# EasyEDA Pro project ProPrj_轮腿机器人-世博同学-正式版.epro, board PCB_ServoDebug
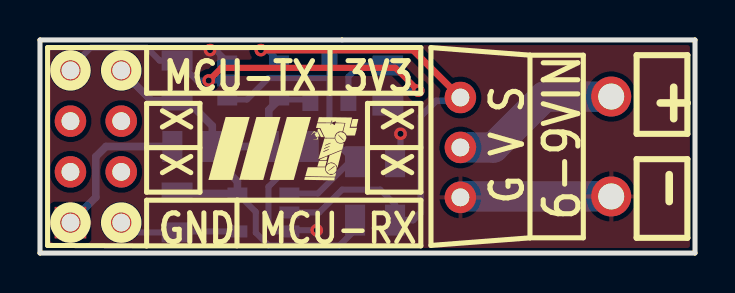
[diagram p7: board, top side]
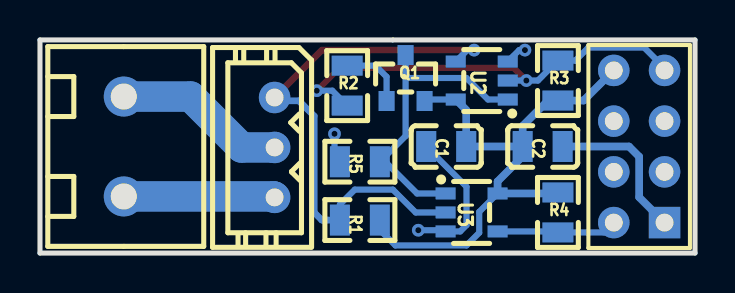
[diagram p8: board, bottom side, seen from below]

Outline 32.77 x 10.67 mm; copper layers: Top Layer, Bottom Layer. Coordinates in mm from the lower left corner of the outline.
Outline path: 0,10.67 32.77,10.67 32.77,0 0,0 0,10.67
Stack: Top Layer 0.035mm / Dielectric1 1.51mm FR4 er 4.5 / Bottom Layer 0.035mm

## Design rules (mm)
spacing Default (default): track to track 0.152, other pairs 0 to 0.152
track width Default (default): min 0.254, default 0.254, max 25.4
differential pair differentialPair (default): width min 0.127, default 0.254, max 2.54; gap min 0.152, default 0.152
via Default (default): diameter min 0.61, default 0.61, max 100.025; hole min 0.305, default 0.305, max 59.995
pour e81 uses gge4359

## Placement (name value [footprint] x y rotation side)
C1  0.1uF  [C0805]  12.45 5.33 0 bottom
C2  0.1uF  [C0805]  7.62 5.33 180 bottom
H1  HDR-F-2.54_2x4  [HDR-F-2.54_2X4]  2.79 5.33 90 bottom
H2  -  [5264-3A]  24.13 10.29 270 bottom
P3  WJ126V-5.0-2P  [CONN-TH_WJ126V-5.0-2P]  28.58 5.33 180 bottom
Q1  SS8550  [SOT-23_L2.9-W1.3-P0.95-LS2.4-BR]  14.48 8.76 270 bottom
R1  10k  [R0805]  16.76 1.65 180 bottom
R2  10k  [R0805]  17.4 8.38 90 bottom
R3  10k  [R0805]  6.86 8.64 270 bottom
R4  10k  [R0805]  6.86 2.03 90 bottom
R5  10k  [R0805]  16.76 4.57 180 bottom
U2  SN74LVC1G126DBVR  [SOT-23-5_L3.0-W1.7-P0.95-LS2.8-BR]  10.67 8.64 180 bottom
U3  SN74LVC1G125DBVR  [SOT-23-5_L3.0-W1.7-P0.95-LS2.8-BR]  11.18 2.03 0 bottom

## Footprints (pads in the part's own frame, mm; a bottom-side part is the same pattern mirrored in y, then rotated)
5264-3A
  round 1.575 hole 0.889: 1(2.5,3.1) 2(5,3.1) 3(7.5,3.1)
C0805
  rect 1x1.55 smd: 1(-1,0) 2(1,0)
CONN-TH_WJ126V-5.0-2P
  round 2 hole 1.3: 1(0,2.501) 2(0,-2.501)
HDR-F-2.54_2X4
  rect 1.575x1.575 hole 0.889: 1(-3.81,-1.27)
  round 1.575 hole 0.889: 2(-3.81,1.27) 3(-1.27,-1.27) 4(-1.27,1.27) 5(1.27,-1.27) 6(1.27,1.27) 7(3.81,-1.27) 8(3.81,1.27)
R0805
  rect 1x1.55 smd: 1(-1,0) 2(1,0)
SOT-23-5_L3.0-W1.7-P0.95-LS2.8-BR
  rect 1x0.6 smd: 1(1.3,-0.95) 2(1.3,0) 3(1.3,0.95) 4(-1.3,0.95) 5(-1.3,-0.95)
SOT-23_L2.9-W1.3-P0.95-LS2.4-BR
  rect 1x0.8 smd: 1(1.15,-0.95) 2(1.15,0.95) 3(-1.15,0)

## Nets
As in the schematic.

Pads without a net: H1 3 4 5 6

## Via types
v1: diameter 0.635, hole 0.305, Top Layer to Bottom Layer, 6 vias

## Routing (per net, layer and track width the routed paths; a pad name or vN(x,y) marks a point on that pad's centre or on a via; arc(x,y) is an arc through that point)
+3.3V: length 28
  Bottom Layer w0.305: U2.5 13.46,7.69 Q1.2 ; U3.5 10.8,2.06 10.8,1.02 11.43,0.38 14.99,0.38 15.76,1.16 R1.2
  Bottom Layer w0.381: R4.2 6.91,2.98 U3.5 9.88,3.59 8.62,4.84 C2.1 8.62,6.37 7.35,7.64 R3.2 5.57,7.64 H1.8 ; U2.5 11.45,7.16 C1.1 ; C1.1 11.59,5.33 ; C1.1 8.76,5.33
GND: length 25.4
  Bottom Layer w0.305: R5.1 18.03,4.84 v1(18.03,5.97) ; v1(8.51,10.16) 8.79,10.16 U2.3 ; v1(13.84,1.14) 12.54,1.14 U3.3 11.75,1.08 11.43,1.4 11.43,3.32 C1.2
  Bottom Layer w0.381: C2.2 3.3,5.33 2.79,4.83 2.79,2.79 H1.1
  Bottom Layer w1.524: P3.2 21.08,2.83 H2.3
VIN: length 8.6
  Bottom Layer w1.524: 21.03,5.29 22.68,5.29 25.23,7.83 P3.1
DATA: length 27.6
  Top Layer w0.33: v1(11.05,10.16) 18.66,10.16 H2.1
  Bottom Layer w0.305: R1.1 17.76,2.43 17.02,3.18 15.11,3.18 13.97,2.03 U3.2 ; v1(11.05,10.16) 11.39,10.16 U2.4
  Bottom Layer w0.33: H2.1 20.86,7.62 19.81,7.62 19.05,6.86 19.05,2.03 18.67,1.65 R1.1
R2_2: length 3.4
  Bottom Layer w0.305: Q1.1 15.43,8.82 15.99,9.38 R2.2
SERVO_RX: length 6
  Bottom Layer w0.305: H1.2 4.56,1.03 R4.1 6.91,1.08 U3.4
SERVO_TX: length 22.1
  Top Layer w0.305: v1(8.44,8.64) 9.07,9.27 17.78,9.27 v1(18.92,8.13)
  Bottom Layer w0.305: R2.1 18.15,8.13 v1(18.92,8.13) ; U2.2 v1(8.44,8.64) 7.86,8.64 R3.1 5.99,9.64 5.33,10.29 2.54,10.29 1.52,9.27 H1.7
TXEN: length 15.4
  Bottom Layer w0.305: U2.1 10.35,7.69 11.43,8.76 14.48,8.76 ; 14.48,8.76 Q1.3 ; 14.48,8.76 14.48,5.86 R5.2 15.49,4.57 13.9,2.98 U3.1

## Copper pours and planes (outline as drawn; the poured copper is in the pictures)
GND on Top Layer: -1.27,12.45 -1.78,12.45 -1.78,-1.9 33.15,-1.9 33.15,-3.81 36.45,-3.81 36.45,12.19

## Text on the board
Top Silkscreen Layer: X | MCU-RX | GND | MCU-TX | 3V3 | G V S | 6-9VIN | + | -
